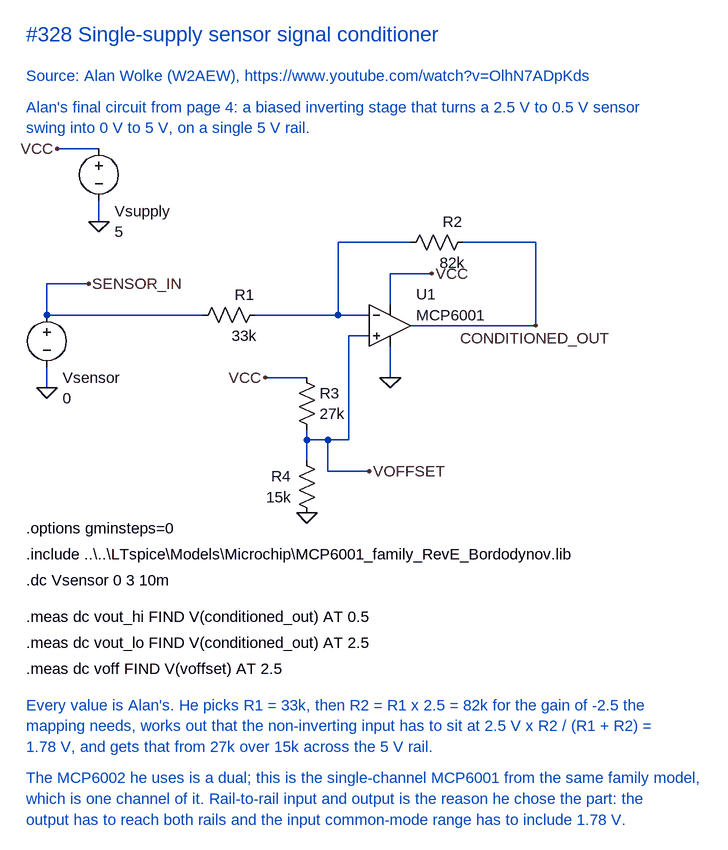
[diagram p0: schematic Sensor signal conditioner.asc]
Sensor signal conditioner.asc, the LTspice schematic file:
Version 4
SHEET 1 1180 920
WIRE 80 448 80 400
WIRE 80 400 144 400
WIRE 80 528 80 560
WIRE 320 448 80 448
WIRE 528 448 400 448
WIRE 576 448 528 448
WIRE 528 336 528 448
WIRE 640 336 528 336
WIRE 832 336 720 336
WIRE 832 464 832 336
WIRE 832 464 640 464
WIRE 160 192 96 192
WIRE 160 272 160 304
WIRE 480 544 416 544
WIRE 480 640 480 624
WIRE 480 672 480 640
WIRE 544 640 480 640
WIRE 544 480 544 640
WIRE 576 480 544 480
WIRE 512 640 512 688
WIRE 512 688 576 688
WIRE 608 432 608 384
WIRE 608 384 672 384
WIRE 608 496 608 544
FLAG 80 560 0
FLAG 96 192 VCC
FLAG 160 304 0
FLAG 416 544 VCC
FLAG 480 752 0
FLAG 672 384 VCC
FLAG 608 544 0
FLAG 144 400 SENSOR_IN
FLAG 576 688 VOFFSET
FLAG 832 464 CONDITIONED_OUT
SYMBOL voltage 80 432 R0
WINDOW 0 24 112 Left 2
WINDOW 3 24 144 Left 2
SYMATTR InstName Vsensor
SYMATTR Value 0
SYMBOL voltage 160 176 R0
WINDOW 0 24 112 Left 2
WINDOW 3 24 144 Left 2
SYMATTR InstName Vsupply
SYMATTR Value 5
SYMBOL res 416 432 R90
WINDOW 0 0 32 VBottom 2
WINDOW 3 32 32 VTop 2
SYMATTR InstName R1
SYMATTR Value 33k
SYMBOL res 736 320 R90
WINDOW 0 0 32 VBottom 2
WINDOW 3 32 32 VTop 2
SYMATTR InstName R2
SYMATTR Value 82k
SYMBOL res 464 528 R0
WINDOW 0 36 40 Left 2
WINDOW 3 36 72 Left 2
SYMATTR InstName R3
SYMATTR Value 27k
SYMBOL res 464 656 R0
WINDOW 0 -8 40 Right 2
WINDOW 3 -8 72 Right 2
SYMATTR InstName R4
SYMATTR Value 15k
SYMBOL Opamps\opamp2 608 400 R0
WINDOW 0 40 16 Left 2
WINDOW 3 40 48 Left 2
SYMATTR InstName U1
SYMATTR Value MCP6001
TEXT 48 16 Left 3 ;#328 Single-supply sensor signal conditioner
TEXT 48 80 Left 2 ;Source: Alan Wolke (W2AEW), https://www.youtube.com/watch?v=OlhN7ADpKds
TEXT 48 128 Left 2 ;Alan's final circuit from page 4: a biased inverting stage that turns a 2.5 V to 0.5 V sensor
TEXT 48 160 Left 2 ;swing into 0 V to 5 V, on a single 5 V rail.
TEXT 48 816 Left 2 !.include ..\..\LTspice\Models\Microchip\MCP6001_family_RevE_Bordodynov.lib
TEXT 48 856 Left 2 !.dc Vsensor 0 3 10m
TEXT 48 776 Left 2 !.options gminsteps=0
TEXT 48 912 Left 2 !.meas dc vout_hi FIND V(conditioned_out) AT 0.5
TEXT 48 952 Left 2 !.meas dc vout_lo FIND V(conditioned_out) AT 2.5
TEXT 48 992 Left 2 !.meas dc voff FIND V(voffset) AT 2.5
TEXT 48 1048 Left 2 ;Every value is Alan's. He picks R1 = 33k, then R2 = R1 x 2.5 = 82k for the gain of -2.5 the
TEXT 48 1080 Left 2 ;mapping needs, works out that the non-inverting input has to sit at 2.5 V x R2 / (R1 + R2) =
TEXT 48 1112 Left 2 ;1.78 V, and gets that from 27k over 15k across the 5 V rail.
TEXT 48 1160 Left 2 ;The MCP6002 he uses is a dual; this is the single-channel MCP6001 from the same family model,
TEXT 48 1192 Left 2 ;which is one channel of it. Rail-to-rail input and output is the reason he chose the part: the
TEXT 48 1224 Left 2 ;output has to reach both rails and the input common-mode range has to include 1.78 V.

The netlist it stands for:
* Sensor signal conditioner.asc
Vsensor SENSOR_IN 0 0
Vsupply VCC 0 5
R1 N001 SENSOR_IN 33k
R2 CONDITIONED_OUT N001 82k
R3 VCC VOFFSET 27k
R4 VOFFSET 0 15k
XU1 VOFFSET N001 VCC 0 CONDITIONED_OUT MCP6001  ; pins In+ In- V+ V- OUT
* #328 Single-supply sensor signal conditioner
* Source: Alan Wolke (W2AEW), https://www.youtube.com/watch?v=OlhN7ADpKds
* Alan's final circuit from page 4: a biased inverting stage that turns a 2.5 V to 0.5 V sensor
* swing into 0 V to 5 V, on a single 5 V rail.
.include ..\..\LTspice\Models\Microchip\MCP6001_family_RevE_Bordodynov.lib
.dc Vsensor 0 3 10m
.options gminsteps=0
.meas dc vout_hi FIND V(conditioned_out) AT 0.5
.meas dc vout_lo FIND V(conditioned_out) AT 2.5
.meas dc voff FIND V(voffset) AT 2.5
* Every value is Alan's. He picks R1 = 33k, then R2 = R1 x 2.5 = 82k for the gain of -2.5 the
* mapping needs, works out that the non-inverting input has to sit at 2.5 V x R2 / (R1 + R2) =
* 1.78 V, and gets that from 27k over 15k across the 5 V rail.
* The MCP6002 he uses is a dual; this is the single-channel MCP6001 from the same family model,
* which is one channel of it. Rail-to-rail input and output is the reason he chose the part: the
* output has to reach both rails and the input common-mode range has to include 1.78 V.
.backanno
.end